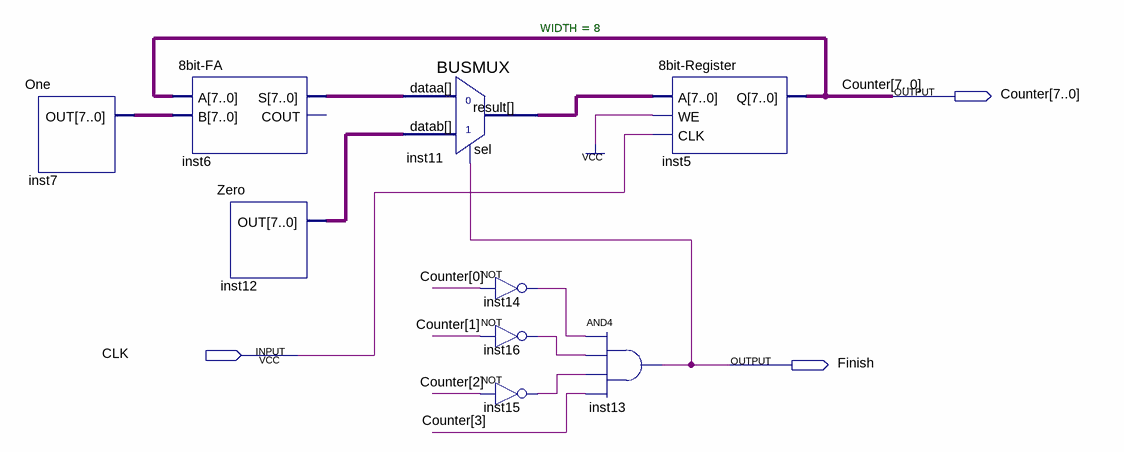
[diagram p0: schematic sheet]
// Quartus schematic 8-Counter.bdf as structural Verilog: 9 symbols, 3 pins
module \8-Counter  (
  input  CLK,
  output [7:0] Counter,
  output Finish
);

  wire inst14_out, inst15_out, inst16_out;
  wire [7:0] inst6_s, inst7_out, inst11_result, inst12_out;

  One inst7 (.OUT(inst7_out));
  \8bit-FA  inst6 (.A(Counter), .B(inst7_out), .S(inst6_s));  // open: COUT
  Zero inst12 (.OUT(inst12_out));
  BUSMUX #(.WIDTH(8)) inst11 (.datab(inst12_out), .sel(Finish), .dataa(inst6_s), .result(inst11_result));
  not inst14 (inst14_out, Counter[0]);
  not inst16 (inst16_out, Counter[1]);
  not inst15 (inst15_out, Counter[2]);
  and inst13 (Finish, inst14_out, inst16_out, inst15_out, Counter[3]);
  \8bit-Register  inst5 (.A(inst11_result), .WE(1'b1), .CLK(CLK), .Q(Counter));
endmodule
